# Altium project Interface-Board-7500-0428.PrjPcb (part 3 of 4)
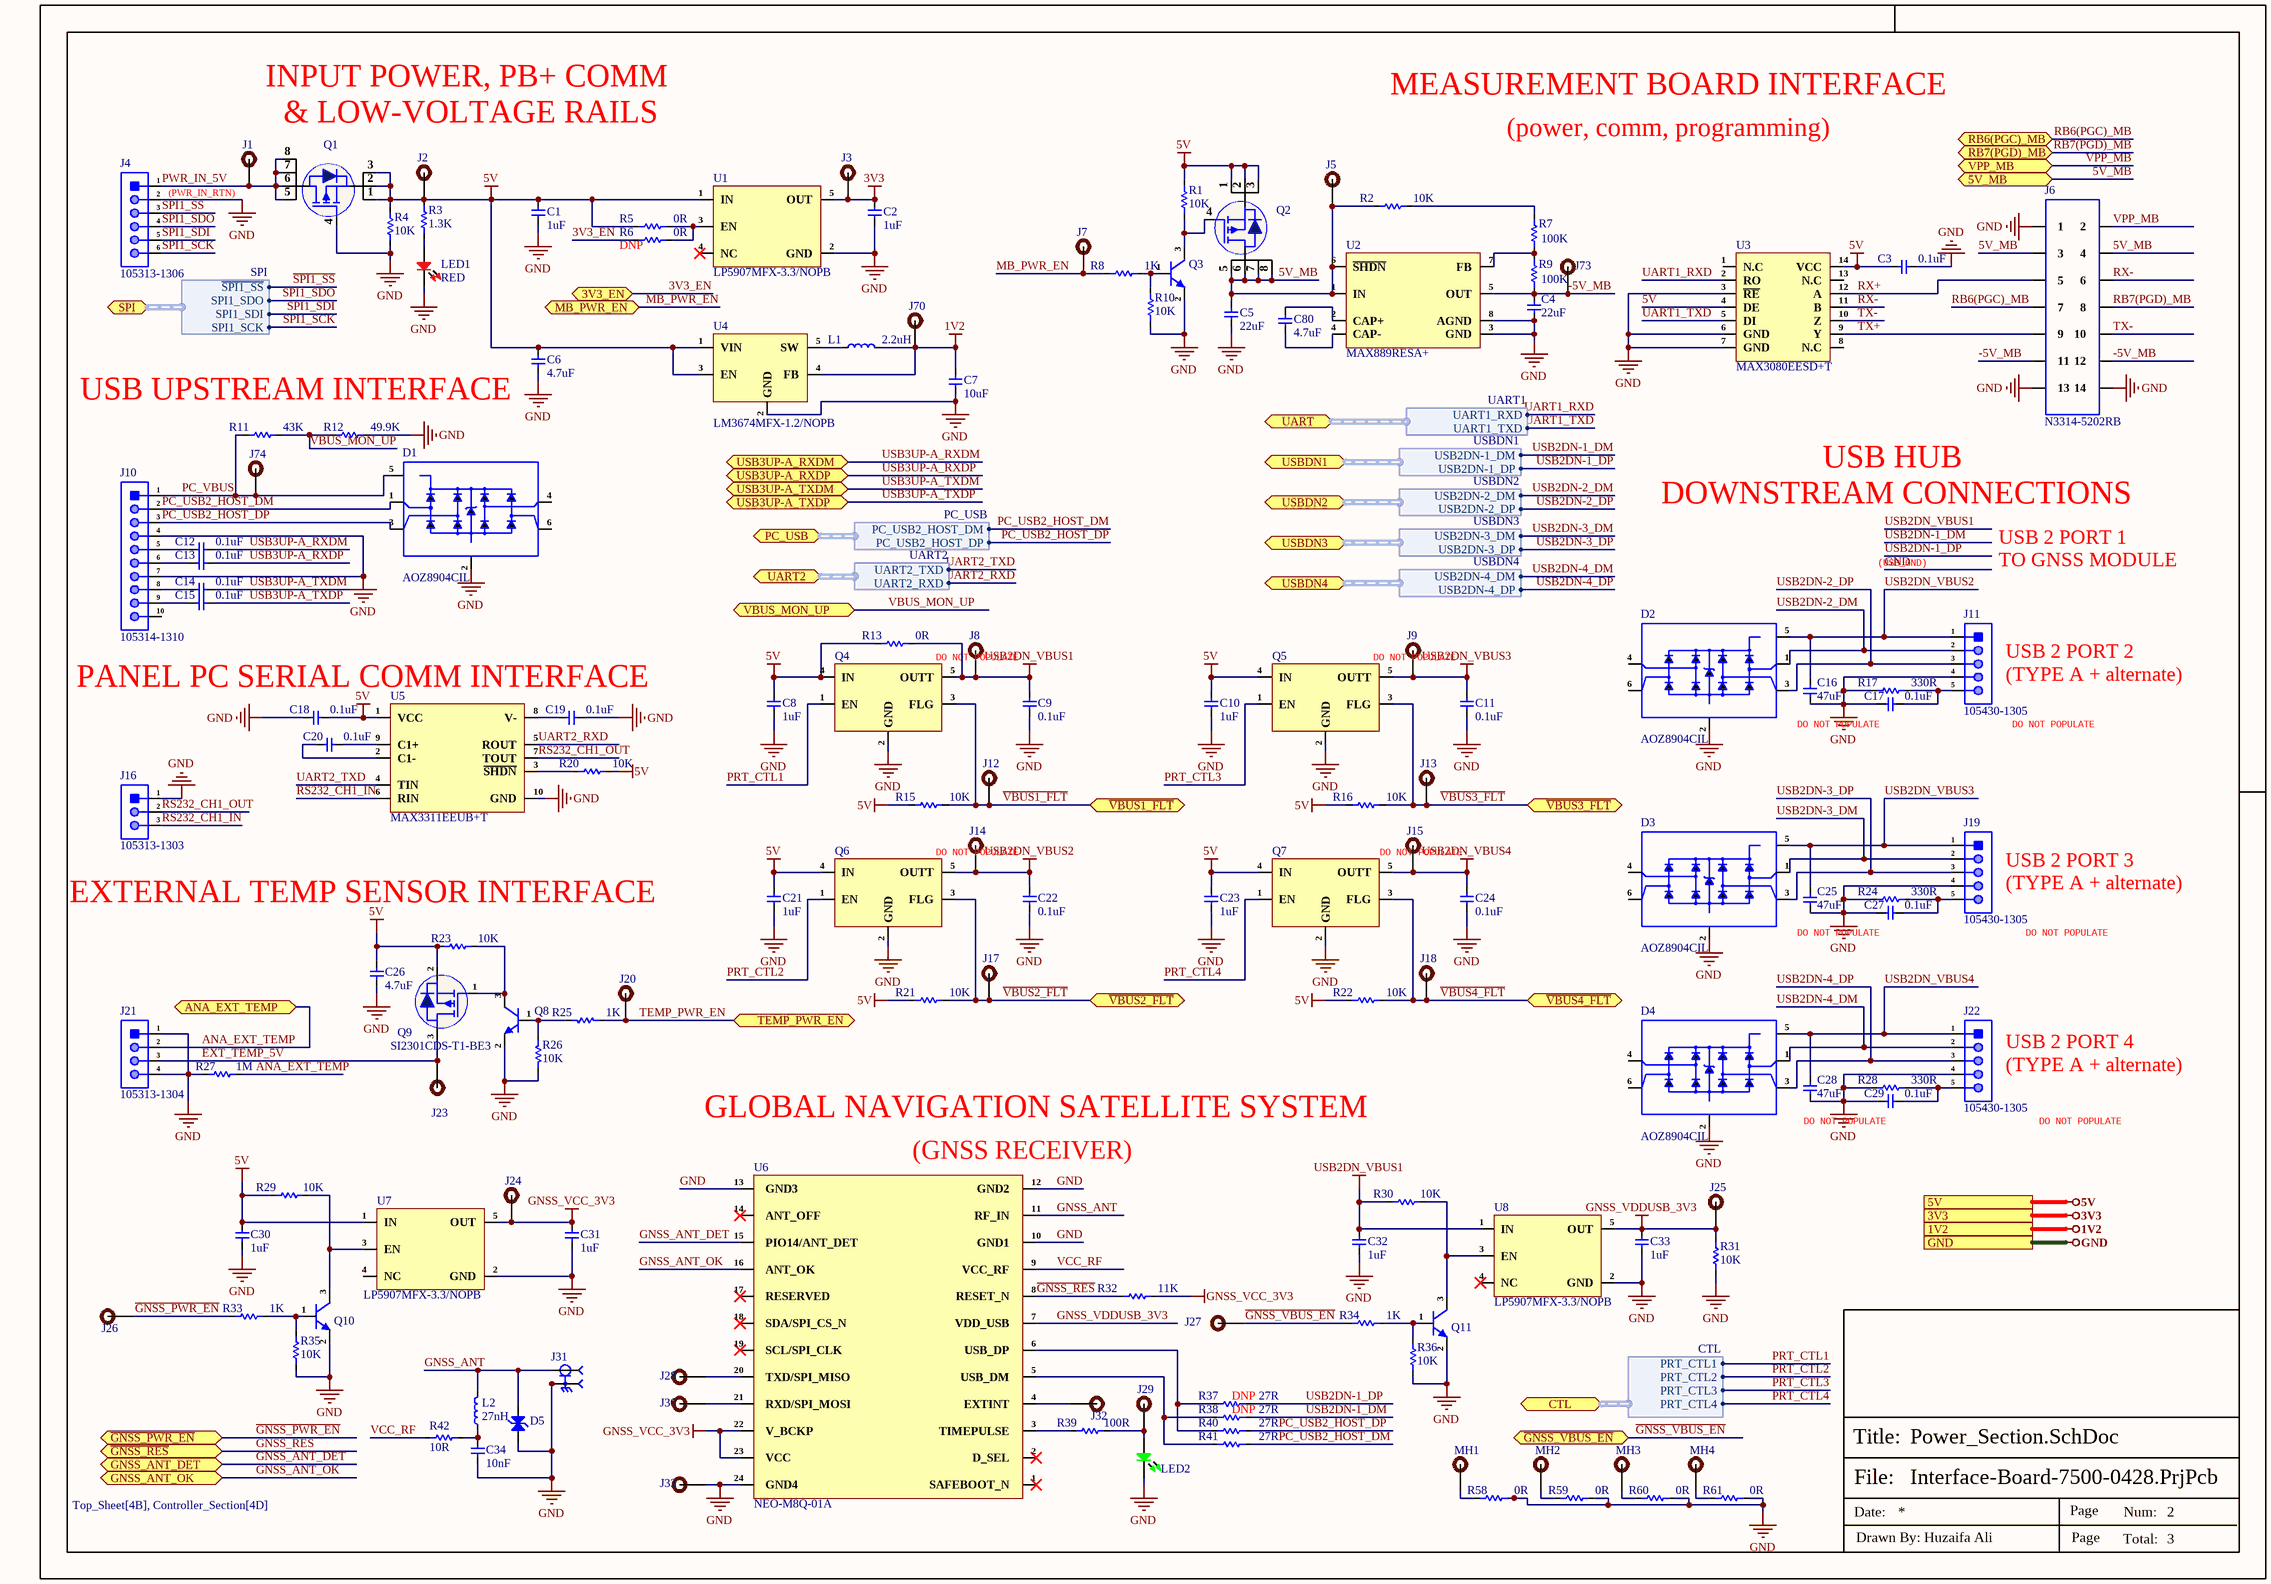
[diagram p4: Power_Section.SchDoc]

## Sheet Power_Section.SchDoc (continued)
### Library data of the parts
C1 C2 C8 C10 C21 C23 C30-C33 = CC0402KRX5R6BB105: CAP CER 1UF 10V X5R 0402; Manufacturer: Yageo; Tolerance: 10%; Dissipation Factor: 15%; Item Type: Capacitor; Supplier 1: Mouser; Manufacturer Part Number: CC0402KRX5R6BB105; RoHS: Yes; Category: Ceramic Capacitors; Stock 1: 6711367; Pricing 1: 1=0.11000, 10=0.05500, 50=0.05500, 100=0.03300, 500=0.02700, 1000=0.02200, 2500=0.02100, 10000=0.01800 (USD); Mount: Surface Mount; Case/Package: 0402; Number of Pins: 2; Case Code (Metric): 1005; Case Code (Imperial): 0402; Min Operating Temperature: -55°C; Max Operating Temperature: 85°C; Capacitance: 1uF; Dielectric: X5R; Package Quantity: 1; Voltage Rating: 10V; Packaging: Tape and Reel; Voltage Rating (DC): 10V; Termination: SMD/SMT; Resistor Type: Ceramic; Series: CC; Construction: Flat; Length: 1mm; Width: 0.02inch; Height: 0.5mm; Thickness: 0.022inch; Depth: 0.5mm; Radiation Hardening: No; REACH SVHC: No SVHC; Lead Free: Lead Free; Halogen Free: Halogen Free; RoHS Compliant: Yes; ComponentLink1URL: https://datasheet.ciiva.com/176/upy-gphc-x5r-4v-to-50v-12-176704.pdf?src-supplier=Digi-Key; ComponentLink1Description: https://datasheet.ciiva.com/176/upy-gphc-x5r-4v-to-50v-12-176704.pdf?src-supplier=Digi-Key; ComponentLink2URL: https://datasheet.ciiva.com/176/mlccorderingcode-176705.pdf?src-supplier=Digi-Key; ComponentLink2Description: https://datasheet.ciiva.com/176/mlccorderingcode-176705.pdf?src-supplier=Digi-Key; ComponentLink3URL: https://datasheet.ciiva.com/176/mlccorderingcode-176706.pdf?src-supplier=Digi-Key; ComponentLink3Description: https://datasheet.ciiva.com/176/mlccorderingcode-176706.pdf?src-supplier=Digi-Key; Supplier Part Number 1: 603-CC402KRX5R6BB105; LCSC Part Number: C106254
C3 C9 C11-C15 C17-C20 C22 C24 C27 C29 = GRM155R71C104KA88D: CAP CER 0.1UF 16V X7R 0402; Manufacturer: Murata; Material: Ceramic; Value: 100nF; Tolerance: 10%; Insulation Resistance: 10GR; Item Type: Capacitor; Supplier 1: Arrow Electronics; Manufacturer Part Number: GRM155R71C104KA88D; RoHS: Yes; Category: Ceramic Capacitors; Stock 1: 1690322; Pricing 1: 10000=0.00480, 30000=0.00470, 100000=0.00350, 250000=0.00330 (USD); Mounting Technology: Surface Mount; Case/Package: 0402; Pins: 2; Case Code (Metric): 1005; Case Code (Imperial): 0402; Dielectric Material: Ceramic; Min Operating Temperature: -55°C; Max Operating Temperature: 125°C; Voltage Rating: 16V; Packaging: Tape and Reel; Voltage Rating (DC): 16V; Package Quantity: 1; Dielectric: X7R; Termination: SMD/SMT; Voltage: 16V; Series: GRM; Length: 1mm; Width: 0.02inch; Height: 0.5mm; Thickness: 0.022inch; Depth: 0.5mm; Radiation Hardening: No; Lead Free: Lead Free; RoHS Compliant: Yes; ComponentLink1URL: https://datasheet.ciiva.com/129/grm155r71c104ka88-01-129739.pdf?src-supplier=Digi-Key; ComponentLink1Description: https://datasheet.ciiva.com/129/grm155r71c104ka88-01-129739.pdf?src-supplier=Digi-Key; ComponentLink2URL: https://datasheet.ciiva.com/129/grm155r71c104ka88-01-129740.pdf?src-supplier=Digi-Key; ComponentLink2Description: https://datasheet.ciiva.com/129/grm155r71c104ka88-01-129740.pdf?src-supplier=Digi-Key; ComponentLink3URL: https://datasheet.ciiva.com/18102/getdatasheetpartid-85307-18102905.pdf?src-supplier=Verical; ComponentLink3Description: https://datasheet.ciiva.com/18102/getdatasheetpartid-85307-18102905.pdf?src-supplier=Verical; ComponentLink4URL: https://datasheet.ciiva.com/29199/454098-da-01-en-vs-kondensator-0402-29199799.pdf?src-supplier=Conrad; ComponentLink4Description: https://datasheet.ciiva.com/29199/454098-da-01-en-vs-kondensator-0402-29199799.pdf?src-supplier=Conrad; ComponentLink5URL: https://datasheet.ciiva.com/7937/4360-7937615.pdf?src-supplier=Element14; ComponentLink5Description: https://datasheet.ciiva.com/7937/4360-7937615.pdf?src-supplier=Element14; ComponentLink6URL: https://datasheet.ciiva.com/14116/grmseries-highdielectrictype-eng-14116878.pdf?src-supplier=Distrelec; ComponentLink6Description: https://datasheet.ciiva.com/14116/grmseries-highdielectrictype-eng-14116878.pdf?src-supplier=Distrelec; ComponentLink7URL: https://datasheet.ciiva.com/14103/grmseries-highdielectrictype-eng-14103750.pdf?src-supplier=Distrelec; ComponentLink7Description: https://datasheet.ciiva.com/14103/grmseries-highdielectrictype-eng-14103750.pdf?src-supplier=Distrelec; ComponentLink8URL: https://datasheet.ciiva.com/28534/4360-28534127.pdf?src-supplier=Element14; ComponentLink8Description: https://datasheet.ciiva.com/28534/4360-28534127.pdf?src-supplier=Element14; ComponentLink9URL: https://datasheet.ciiva.com/28534/4360-28534133.pdf?src-supplier=Element14; ComponentLink9Description: https://datasheet.ciiva.com/28534/4360-28534133.pdf?src-supplier=Element14; ComponentLink10URL: https://datasheet.ciiva.com/16199/product-16199000.pdf?src-supplier=Future+Electronics; ComponentLink10Description: https://datasheet.ciiva.com/16199/product-16199000.pdf?src-supplier=Future+Electronics; Supplier Part Number 1: GRM155R71C104KA88D; LCSC Part Number: C71629
C4 C5 = GRM158R61A226ME15D: CAP CER 22UF 10V X5R 0402; Manufacturer: Murata; Material: 4241ConductorMaterial; Dielectric: 1537DielectricType; Tolerance: 20%; Item Type: Capacitor; Supplier: Mouser; Supplier Part Number: 81-GRM158R61A226ME5D; Manufacturer Part Number: GRM158R61A226ME15D; RoHS: Yes; Category: Ceramic Capacitors; Stock: 328944; Pricing: 1=0.46, 10=0.225, 50=0.225, 100=0.146, 1000=0.124, 10000=0.106 (USD); Case/Package: 343Case; Min Operating Temperature: -55°C; Max Operating Temperature: 85°C; Value: 22uF; Voltage Rating: 10V; Voltage Rating (DC): 10V; Length: 1mm; Width: 500um; Height: 800um; Thickness: 800um; LCSC Part Number: C3845593
C6 C26 C80 = CC0402KRX5R6BB475: CAP CER 4.7UF 10V X5R 0402; Manufacturer: Yageo; Tolerance: 10%; Supplier 1: Farnell; Manufacturer Part Number: CC0402KRX5R6BB475; RoHS: Yes; Category: Ceramic Capacitors; Stock 1: 20000; Pricing 1: 10000=0.02310, 50000=0.02100 (GBP); Mount: Surface Mount; Case/Package: 0402; Case Code (Imperial): 0402; Case Code (Metric): 1005; Min Operating Temperature: -55°C; Max Operating Temperature: 85°C; Packaging: Cut Tape; Capacitance: 4.7uF; Voltage Rating: 10V; RoHS Compliant: Yes; ComponentLink1URL: http://www.yageo.com/documents/recent/UPY-GPHC_X5R_4V-to-50V_25.pdf?src-supplier=Digi-Key; ComponentLink1Description: http://www.yageo.com/documents/recent/UPY-GPHC_X5R_4V-to-50V_25.pdf?src-supplier=Digi-Key; Supplier Part Number 1: 3871698; LCSC Part Number: C326586
C7 = CC0402MRX5R6BB106: CAP CER 10UF 10V X5R 0402; Manufacturer: Yageo; Tolerance: 20%; Item Type: Capacitor; Supplier 1: Future Electronics; Manufacturer Part Number: CC0402MRX5R6BB106; RoHS: Yes; Category: Ceramic Capacitors; Stock 1: 80000; Pricing 1: 10000=0.02650, 20000=0.02590, 30000=0.02550, 40000=0.02530, 50000=0.02450 (USD); Mount: Surface Mount; Case/Package: 0402; Case Code (Imperial): 0402; Case Code (Metric): 1005; Min Operating Temperature: -55°C; Max Operating Temperature: 85°C; Packaging: Tape and Reel; Capacitance: 10uF; Voltage Rating: 10V; RoHS Compliant: Yes; ComponentLink1URL: http://www.yageo.com/documents/recent/UPY-GPHC_X5R_4V-to-50V_25.pdf?src-supplier=Digi-Key; ComponentLink1Description: http://www.yageo.com/documents/recent/UPY-GPHC_X5R_4V-to-50V_25.pdf?src-supplier=Digi-Key; Supplier Part Number 1: 6097631; LCSC Part Number: C962143
C16 C25 C28 = CC0805MKX5R5BB476: CAP CER 47UF 6.3V X5R 0805; Manufacturer: Yageo; Tolerance: 20%; Item Type: Capacitor; Supplier 1: Arrow Electronics; Manufacturer Part Number: CC0805MKX5R5BB476; RoHS: Yes; Category: Ceramic Capacitors; Stock 1: 6; Pricing 1: 1=0.25650 (USD); Mount: Surface Mount; Case/Package: 0805; Case Code (Imperial): 0805; Case Code (Metric): 2012; Weight: 0.000194oz; Min Operating Temperature: -55°C; Max Operating Temperature: 85°C; Capacitance: 47uF; Packaging: Tape and Reel; Voltage Rating (DC): 6.3V; Dielectric: X5R; Voltage Rating: 6.3V; Termination: SMD/SMT; Resistor Type: Ceramic; Series: CC; Construction: Flat; Length: 2mm; Width: 0.049inch; Thickness: 0.057inch; Depth: 1.25mm; Radiation Hardening: No; Lead Free: Lead Free; Halogen Free: Halogen Free; RoHS Compliant: Yes; ComponentLink1URL: http://www.mouser.com/ds/2/447/UPY-GPHC_X5R_4V-to-50V_25-1131599.pdf?src-supplier=Mouser; ComponentLink1Description: http://www.mouser.com/ds/2/447/UPY-GPHC_X5R_4V-to-50V_25-1131599.pdf?src-supplier=Mouser; ComponentLink2URL: http://www.yageo.com/documents/recent/UPY-GPHC_X5R_4V-to-50V_25.pdf?src-supplier=Digi-Key; ComponentLink2Description: http://www.yageo.com/documents/recent/UPY-GPHC_X5R_4V-to-50V_25.pdf?src-supplier=Digi-Key; ComponentLink3URL: http://www.yageo.com/documents/recent/UPY-GPHC_X5R_4V-to-50V_19.pdf?src-supplier=Avnet; ComponentLink3Description: http://www.yageo.com/documents/recent/UPY-GPHC_X5R_4V-to-50V_19.pdf?src-supplier=Avnet; Supplier Part Number 1: CC0805MKX5R5BB476; LCSC Part Number: C109461
C34 = CC0603KRX7R7BB103: CAP CER 10000PF 16V X7R 0603; Manufacturer: Yageo; Tolerance: 10%; Item Type: Capacitor; Supplier 1: Arrow Electronics; Manufacturer Part Number: CC0603KRX7R7BB103; RoHS: Yes; Category: Ceramic Capacitors; Stock 1: 3; Pricing 1: 1=0.03600 (USD); Mount: Surface Mount; Case/Package: 0603; Case Code (Imperial): 0603; Case Code (Metric): 1608; Min Operating Temperature: -55°C; Max Operating Temperature: 125°C; Capacitance: 10nF; Voltage Rating: 16V; Voltage Rating (DC): 16V; Packaging: Tape and Reel; Dielectric: X7R; Termination: SMD/SMT; Resistor Type: Ceramic; Series: CC; Construction: Flat; Length: 1.6mm; Width: 0.8mm; Height: 0.8mm; Thickness: 0.035inch; Depth: 0.8mm; Radiation Hardening: No; Lead Free: Lead Free; Halogen Free: Halogen Free; RoHS Compliant: Yes; ComponentLink1URL: https://datasheet.ciiva.com/7978/1489800-7978139.pdf?src-supplier=Element14; ComponentLink1Description: https://datasheet.ciiva.com/7978/1489800-7978139.pdf?src-supplier=Element14; Supplier Part Number 1: CC0603KRX7R7BB103; LCSC Part Number: C519406
D1-D4 = AOZ8904CIL: Ultra-Low Capacitance TVS Diode Array, SOT-23-6L, RoHS; Manufacturer: Alpha & Omega Semiconductor; Direction: Unidirectional; Number of Bidirectional Channels: 4; Reverse Standoff Voltage: 5.5V; Min Breakdown Voltage: 6.6V; Clamping Voltage: 18V; Peak Pulse Power: 50W; Power Line Protection: Yes; Leakage Current: 1uA; Peak Pulse Current: 4A; Item Type: IC; Supplier: Digikey; Supplier Part Number: 785-1755-1-ND; Manufacturer Part Number: AOZ8904CIL; RoHS: Yes; Category: TVS Diodes; Stock: 1165949; Pricing: 1=0.34, 10=0.235, 100=0.1187, 500=0.09684, 1000=0.07185 (USD); Mounting Technology: Surface Mount; Case/Package: SOT-23-6; Pins: 6; Min Operating Temperature: -40°C; Max Operating Temperature: 125°C; Packaging: Tape and Reel; Package Quantity: 6000; Working Voltage: 5.5V; Series: -; Number of Unidirectional Channels: 4; Length: 2.9mm; Depth: 1.6mm; Radiation Hardening: No; RoHS Compliant: Yes; ComponentLink1URL: https://datasheet.ciiva.com/6575/aoz8904cil-6575149.pdf?src-supplier=Digikey; ComponentLink1Description: https://datasheet.ciiva.com/6575/aoz8904cil-6575149.pdf?src-supplier=Digikey; Package: SOT-23-6; JLCPCB Part Number: C2649893; ComponentLink2Description: JLCPCB; ComponentLink2URL: https://jlcpcb.com/partdetail/Alpha_OmegaSemicon-AOZ8904CIL/C2649893
D5 = ACPDQC3V3HT-HF: AUTOMOTIVE DIODE ESD 3.3VWM 5.5V; Manufacturer: Comchip; Supplier: Digikey; Supplier Part Number: 641-ACPDQC3V3HT-HFCT-ND; Manufacturer Part Number: ACPDQC3V3HT-HF; RoHS: No; Stock: 4462; Pricing: 1=0.37, 10=0.255, 100=0.1244, 500=0.10378, 1000=0.07211, 2000=0.0625 (USD); Item Type: Diode
J4 = 105313-1306: CONN HEADER R/A 6POS 2.5MM; Manufacturer: Molex; Supplier: Mouser; Supplier Part Number: 538-105313-1306; Manufacturer Part Number: 105313-1306; RoHS: Yes; Item Type: Header; Stock: 1427; Pricing: 1=2.09, 10=1.9, 50=1.9, 100=1.65, 1000=1.48, 10000=1.39 (USD); ComponentLink1URL: https://www.molex.com/pdm_docs/sd/1053131102_sd.pdf?src-supplier=Digikey; ComponentLink1Description: https://www.molex.com/pdm_docs/sd/1053131102_sd.pdf?src-supplier=Digikey
J6 = N3314-5202RB: 3000 Series; 2.54mm Pitch 14 Way 2 Row Right Angle PCB Header; Solder Term; 2A; Manufacturer: 3M; Number of Contacts: 14; Gender: Male; Current Rating: 1A; Voltage Rating (AC): 350V; Voltage Rating: 1kV; Supplier: Digikey; Supplier Part Number: MHR14S-ND; Manufacturer Part Number: N3314-5202RB; RoHS: Yes; Category: Headers and Wire Housings; Stock: 7247; Pricing: 1=2.23, 10=2.026, 350=1.57111 (USD); Mounting Technology: Through Hole; Contact Plating: Gold; Contact Material: Copper Alloy,Copper; Color: Black; Housing Color: Black; Housing Material: Polyester; Contact Shape: Square; Contact Finish - Mating: GOLD; Insulation Material: Glass; Insulation Color: Black; Min Operating Temperature: -55°C; Max Operating Temperature: 105°C; Number of Rows: 2; Packaging: Bulk; Termination: Solder; Max Current Rating: 2A; Package Quantity: 100; Fastening Type: Latch; Number of Poles: 14; Number of Positions: 14; Working Voltage: 350V; Orientation: Right Angle; Connector Type: Header; Series: 3000; Contact Type: Male Pin; Length: 37.21mm; Pitch: 2.54mm; Lead Pitch: 2.54mm; Depth: 24.6mm; Reach SVHC Compliant: No; Lead Free: Lead Free; RoHS Compliant: Yes; Flammability Rating: UL94 V-0; ComponentLink1URL: https://datasheet.ciiva.com/15188/getdatasheetpartid-335427-15188603.pdf?src-supplier=Verical; ComponentLink1Description: https://datasheet.ciiva.com/15188/getdatasheetpartid-335427-15188603.pdf?src-supplier=Verical; ComponentLink2URL: https://datasheet.ciiva.com/11754/0900766b8077b7df-11754186.pdf?src-supplier=Rs; ComponentLink2Description: https://datasheet.ciiva.com/11754/0900766b8077b7df-11754186.pdf?src-supplier=Rs; ComponentLink3URL: https://datasheet.ciiva.com/719/ts0772-719288.pdf?src-supplier=Digikey; ComponentLink3Description: https://datasheet.ciiva.com/719/ts0772-719288.pdf?src-supplier=Digikey; ComponentLink4URL: https://datasheet.ciiva.com/8051/94653-8051014.pdf?src-supplier=Element14; ComponentLink4Description: https://datasheet.ciiva.com/8051/94653-8051014.pdf?src-supplier=Element14; Item Type: Header
J10 = 105314-1310: CONN HEADER R/A 10POS 2.5MM; Manufacturer: Molex; Item Type: Headers; Number of Positions: 10; Supplier: Mouser; Supplier Part Number: 538-105314-1310; Manufacturer Part Number: 105314-1310; RoHS: Yes; Stock: 1648; Pricing: 1=2.66, 10=2.31, 50=2.31, 100=2.15, 1000=2.15, 10000=1.95 (USD); Mounting Technology: Through Hole; Contact Material: Brass; Contact Shape: Square; Insulation Material: Polymer; Insulation Color: Black; Contact Finish - Mating: GOLD; Min Operating Temperature: -40°C; Max Operating Temperature: 105°C; Connector Type: Header; Fastening Type: Latch; Packaging: Tray; Number of Rows: 2; Termination: Solder; Series: Nano-Fit 105314; Contact Type: Male Pin; RoHS Compliant: Yes; ComponentLink1URL: https://www.molex.com/pdm_docs/sd/1053141104_sd.pdf?src-supplier=Digikey; ComponentLink1Description: https://www.molex.com/pdm_docs/sd/1053141104_sd.pdf?src-supplier=Digikey; ComponentLink2URL: http://www.farnell.com/datasheets/2788570.pdf?src-supplier=Newark; ComponentLink2Description: http://www.farnell.com/datasheets/2788570.pdf?src-supplier=Newark
J11 J19 J22 = 105430-1305: NANO-FIT HDR SMT RA SGL 5CKT 30A; Manufacturer: Molex; Item Type: Header; Supplier: Mouser; Supplier Part Number: 538-105430-1305; Manufacturer Part Number: 105430-1305; RoHS: No; Stock: 818; Pricing: 1=3.62, 10=3.19, 50=3.19, 100=2.54, 1000=2.19, 10000=2.15 (USD)
J16 = 105313-1303: CONN HEADER R/A 3POS 2.5MM; Manufacturer: Molex; Number of Positions: 3; Voltage Rating: 250V; Supplier: Mouser; Supplier Part Number: 538-105313-1303; Manufacturer Part Number: 105313-1303; RoHS: Yes; Item Type: Header; Stock: 1725; Pricing: 1=1.27, 10=1.08, 50=1.08, 100=0.945, 1000=0.945, 10000=0.945 (USD); Mounting Technology: Through Hole; Contact Material: Brass; Contact Shape: Square; Insulation Material: Polymer; Insulation Color: Black; Contact Finish - Mating: GOLD; Min Operating Temperature: -40°C; Max Operating Temperature: 105°C; Number of Rows: 1; Connector Type: Header; Fastening Type: Latch; Packaging: Tray; Termination: Solder; Series: Nano-Fit 105313; Contact Type: Male Pin; RoHS Compliant: Yes; ComponentLink1URL: https://www.molex.com/pdm_docs/sd/1053131102_sd.pdf?src-supplier=Digikey; ComponentLink1Description: https://www.molex.com/pdm_docs/sd/1053131102_sd.pdf?src-supplier=Digikey
J21 = 105313-1304: CONN HEADER R/A 4POS 2.5MM; Manufacturer: Molex; Plating: 154ConductorMaterial; Number of Positions: 4; Voltage Rating: 250V; Current Rating: 8A; Number of Circuits: 4NUMBER; Supplier: Mouser; Supplier Part Number: 538-105313-1304; Manufacturer Part Number: 105313-1304; RoHS: Yes; Item Type: Header; Stock: 4079; Pricing: 1=1.61, 10=1.45, 50=1.45, 100=1.26, 1000=1.11, 10000=1.11 (USD); Mounting Technology: Through Hole; Contact Material: Brass; Contact Shape: Square; Insulation Material: Polymer; Insulation Color: Black; Contact Finish - Mating: GOLD; Min Operating Temperature: -40°C; Max Operating Temperature: 105°C; Connector Type: Header; Fastening Type: Latch; Packaging: Tray; Number of Rows: 1; Termination: Solder; Series: Nano-Fit 105313; Contact Type: Male Pin; Number of Contacts: 4NUMBER; Orientation: 5492OrientationType; Height: 6.84mm; RoHS Compliant: Yes; ComponentLink1URL: http://www.farnell.com/datasheets/2788568.pdf?src-supplier=Farnell; ComponentLink1Description: http://www.farnell.com/datasheets/2788568.pdf?src-supplier=Farnell; ComponentLink2URL: http://www.farnell.com/datasheets/2788568.pdf?src-supplier=Newark; ComponentLink2Description: http://www.farnell.com/datasheets/2788568.pdf?src-supplier=Newark; ComponentLink3URL: https://www.molex.com/pdm_docs/sd/1053131102_sd.pdf?src-supplier=Digikey; ComponentLink3Description: https://www.molex.com/pdm_docs/sd/1053131102_sd.pdf?src-supplier=Digikey
J31 = SMA-J-P-H-ST-TH1: CONN SMA JACK STR 50 OHM PCB; Manufacturer: Samtec; Item Type: RF / Coaxial Connectors; Frequency: 20GHz; Number of Contacts: 1NUMBER; Supplier: Arrow Electronics; Supplier Part Number: SMA-J-P-H-ST-TH1; Manufacturer Part Number: SMA-J-P-H-ST-TH1; RoHS: Yes; Stock: 32413; Pricing: 1=5.81, 25=5.03, 50=4.25 (USD); ComponentLink1URL: https://datasheet.ciiva.com/646/sma-j-p-x-st-th1-mkt-646059.pdf?src-supplier=Digikey; ComponentLink1Description: https://datasheet.ciiva.com/646/sma-j-p-x-st-th1-mkt-646059.pdf?src-supplier=Digikey
L1 = NR3012T2R2M: FIXED IND 2.2UH 1.2A 96 MOHM SMD; Manufacturer: Taiyo Yuden; Item Type: Inductors; Supplier 1: Digikey; Manufacturer Part Number: NR3012T2R2M; RoHS: Yes; Stock 1: 5366; Pricing 1: 1=0.24, 10=0.196, 25=0.1812, 50=0.166, 100=0.1463, 250=0.14184, 500=0.12674, 1000=0.10625 (USD); ComponentLink1URL: https://datasheet.ciiva.com/8499/nr3012t2r2m-ss-8499238.pdf?src-supplier=Avnet; ComponentLink1Description: https://datasheet.ciiva.com/8499/nr3012t2r2m-ss-8499238.pdf?src-supplier=Avnet; ComponentLink2URL: https://datasheet.ciiva.com/1043/wound04-e-1043497.pdf?src-supplier=Digikey; ComponentLink2Description: https://datasheet.ciiva.com/1043/wound04-e-1043497.pdf?src-supplier=Digikey; ComponentLink3URL: https://datasheet.ciiva.com/1043/wound04-e-1043498.pdf?src-supplier=Digikey; ComponentLink3Description: https://datasheet.ciiva.com/1043/wound04-e-1043498.pdf?src-supplier=Digikey; ComponentLink4URL: https://datasheet.ciiva.com/1043/wound04-e-1043499.pdf?src-supplier=Digikey; ComponentLink4Description: https://datasheet.ciiva.com/1043/wound04-e-1043499.pdf?src-supplier=Digikey; ComponentLink5URL: https://datasheet.ciiva.com/8002/wound04-e-8002122.pdf?src-supplier=Element14; ComponentLink5Description: https://datasheet.ciiva.com/8002/wound04-e-8002122.pdf?src-supplier=Element14; Supplier Part Number 1: 587-1642-1-ND; LCSC Part Number: C525010
L2 = B82496C3270J000: FIXED IND 27NH 360MA 550MOHM SMD; Manufacturer: TDK EPCOS; Item Type: Inductor; Supplier 1: Digikey; Manufacturer Part Number: B82496C3270J000; RoHS: Yes; Stock 1: 40469; Pricing 1: 1=0.36, 10=0.291, 25=0.2688, 50=0.2464, 100=0.2172, 250=0.21052, 500=0.18814, 1000=0.1523 (USD); ComponentLink1URL: https://datasheet.ciiva.com/22704/78400-22704383.pdf?src-supplier=Element14; ComponentLink1Description: https://datasheet.ciiva.com/22704/78400-22704383.pdf?src-supplier=Element14; ComponentLink2URL: https://datasheet.ciiva.com/22684/78400-22684183.pdf?src-supplier=Element14; ComponentLink2Description: https://datasheet.ciiva.com/22684/78400-22684183.pdf?src-supplier=Element14; Supplier Part Number 1: 495-2029-1-ND; LCSC Part Number: C2046375
LED1 = NCD0603R3: RED LED 0603 Light Emitting Diodes; Manufacturer: Foshan NationStar Optoelectronics; Manufacturer Part Number: NCD0603R3; Package: 0603; Item Type: LED; LCSC Part Number: C3151730; ComponentLink1Description: LCSC; ComponentLink1URL: https://www.lcsc.com/product-detail/Light-Emitting-Diodes-LED_Foshan-NationStar-Optoelectronics-NCD0603R3_C3151730.html
LED2 = NCD0603G2: Emerald 0603 Light Emitting Diodes (LED) ROHS; Manufacturer: Foshan NationStar Optoelectronics; Manufacturer Part Number: NCD0603G2; Package: 0603; LCSC Part Number: C87326; Item Type: LED; ComponentLink1Description: LCSC; ComponentLink1URL: https://www.lcsc.com/product-detail/Light-Emitting-Diodes-LED_Foshan-NationStar-Optoelectronics-NCD0603G2_C87326.html
MH1-MH4 = M4 Mounting Hole: -; Manufacturer Part Number: M4 Mounting Hole; Item Type: Mounting Hole
Q1 Q2 = SI4463DY: 20V 11.5A 12mΩ@11.5A,4.5V 1W 1.5V@250uA 1PCSPChannel SOIC-8 MOSFETs ROHS; Manufacturer: ON Semiconductor / Fairchild; Rise Time: 15ns; Fall Time: 60ns; Turn-Off Delay Time: 120ns; Continuous Drain Current (ID): -11.5A; Gate to Source Voltage (Vgs): 12V; Drain to Source Resistance: 10mR; Polarity: P-CHANNEL; Power Dissipation: 2.5W; Drain to Source Breakdown Voltage: -20V; Supplier: Farnell; LCSC Part Number: C3279922; Manufacturer Part Number: SI4463DY; RoHS: Yes; Item Type: MOSFETs; Stock: 188616; Pricing: 472=0.62 (GBP); Case/Package: SOIC; Pins: 8; Min Operating Temperature: -55°C; Max Operating Temperature: 150°C; Package Quantity: 2500; Packaging: Tape and Reel; RoHS Compliant: Yes; ComponentLink1URL: http://components.arrow.com/part/dataview/3004105S7561270N7769?src-supplier=Arrow+Electronics; ComponentLink1Description: http://components.arrow.com/part/dataview/3004105S7561270N7769?src-supplier=Arrow+Electronics
Q3 Q8 Q10 Q11 = MMBT2222ATT3G: Small Signal Bipolar Transistor, 0.6A I(C), 40V V(BR)CEO, 1-Element, NPN, Silicon; Manufacturer: ON Semiconductor; Supplier: Digikey; Supplier Part Number: MMBT2222ATT3GOSCT-ND; Manufacturer Part Number: MMBT2222ATT3G; RoHS: Yes; Category: BJTs; Stock: 7029; Pricing: 1=0.12, 10=0.082, 100=0.0441, 500=0.03466, 1000=0.02407, 2000=0.01994, 5000=0.01885 (USD); ComponentLink1URL: https://datasheet.ciiva.com/980/mmbt2222lt1-d-980718.pdf?src-supplier=Digikey; ComponentLink1Description: https://datasheet.ciiva.com/980/mmbt2222lt1-d-980718.pdf?src-supplier=Digikey; ComponentLink2URL: https://datasheet.ciiva.com/4724/mmbt2222att1-d-81771-4724629.pdf?src-supplier=Mouser; ComponentLink2Description: https://datasheet.ciiva.com/4724/mmbt2222att1-d-81771-4724629.pdf?src-supplier=Mouser
Q4-Q7 = AP22816BKAWT-7: USBPOWERSWITCHTSOT25T&R3K; Manufacturer: Diodes; Item Type: IC; Number of Channels: 1NUMBER; Supplier: Digikey; Supplier Part Number: 31-AP22816BKAWT-7CT-ND; Manufacturer Part Number: AP22816BKAWT-7; RoHS: No; Stock: 8685; Pricing: 1=0.31, 10=0.248, 25=0.2264, 100=0.1686, 250=0.15276, 500=0.12644, 1000=0.09483 (USD)
Q9 = SI2301CDS-T1-BE3: Transistor MOSFET P-CH 20V 3.1A 3-Pin SOT-23; Manufacturer: Vishay; Continuous Drain Current (ID): -2.3A; Drain to Source Breakdown Voltage: -20V; Drain to Source Resistance: 90mR; Gate to Source Voltage (Vgs): 8V; Number of Channels: 1NUMBER; Power Dissipation: 860mW; Turn-Off Delay Time: 30ns; Turn-On Delay Time: 11ns; Supplier: Digikey; Supplier Part Number: 742-SI2301CDS-T1-BE3CT-ND; Manufacturer Part Number: SI2301CDS-T1-BE3; RoHS: Yes; Category: MOSFETs; Stock: 6842; Pricing: 1=0.37, 10=0.289, 100=0.1734, 500=0.1606, 1000=0.1092 (USD); Min Operating Temperature: -55°C; Max Operating Temperature: 150°C; Drain to Source Voltage (Vdss): -20V; Height: 1.12mm
R1 R2 R4 R10 R15 R16 R20-R23 R26 R29-R31 R35 R36 = RT0402BRD0710KL: RES SMD 10K OHM 0.1% 1/16W 0402; Manufacturer: Yageo; Item Type: Resistor; Supplier: Future Electronics; Supplier Part Number: 1236728; Manufacturer Part Number: RT0402BRD0710KL; RoHS: Yes; Category: Chip SMD Resistors; Stock: 490000; Pricing: 10000=0.0218, 20000=0.0213, 30000=0.021, 50000=0.0206, 100000=0.0199 (USD); ComponentLink1URL: https://datasheet.ciiva.com/12836/pyu-rt-1-to-0-05-rohs-l-4-12836454.pdf?src-supplier=Mouser; ComponentLink1Description: https://datasheet.ciiva.com/12836/pyu-rt-1-to-0-05-rohs-l-4-12836454.pdf?src-supplier=Mouser; LCSC Part Number: C190095
R3 = ERJ-2GEJ132X: RES SMD 1.3K OHM 5% 1/10W 0402
R5 R6 R13 = RCS04020000Z0ED: RES SMD 0 OHM JUMPER 1/5W 0402; Manufacturer: Vishay Dale; Resistance: 0mR; Max Power Dissipation: 200mW; Item Type: Resistor; Supplier 1: Digi-Key; Manufacturer Part Number: RCS04020000Z0ED; Stock 1: 35470; Pricing 1: 1=0.1, 10=0.083, 25=0.0576, 50=0.0448, 100=0.032, 250=0.02496, 500=0.01984, 1000=0.01408, 5000=0.01088 (USD); Case/Package: 0402; Case Code (Metric): 1005; Case Code (Imperial): 0402; Min Operating Temperature: -55°C; Max Operating Temperature: 155°C; Packaging: Tape and Reel; Resistor Type: Thick Film; Number of Terminations: 2; Features: Automotive AEC-Q200; Length: 0.039inch; Width: 0.02inch; Height: 0.016inch; RoHS Compliant: Yes; ComponentLink1URL: http://www.farnell.com/datasheets/2618474.pdf?src-supplier=Farnell; ComponentLink1Description: http://www.farnell.com/datasheets/2618474.pdf?src-supplier=Farnell; ComponentLink2URL: http://www.farnell.com/datasheets/2618474.pdf?src-supplier=Element14; ComponentLink2Description: http://www.farnell.com/datasheets/2618474.pdf?src-supplier=Element14; ComponentLink3URL: http://www.vishay.com/docs/20065/rcse3.pdf?src-supplier=Digi-Key; ComponentLink3Description: http://www.vishay.com/docs/20065/rcse3.pdf?src-supplier=Digi-Key; ComponentLink4URL: http://www.farnell.com/datasheets/2618474.pdf?src-supplier=Newark; ComponentLink4Description: http://www.farnell.com/datasheets/2618474.pdf?src-supplier=Newark; Supplier Part Number 1: 541-2877-1-ND; LCSC Part Number: C844673
R7 R9 = RT0402BRD07100KL: RES SMD 100K OHM 0.1% 1/16W 0402; Manufacturer: Yageo; Voltage Rating (DC): 50V; Item Type: Resistor; Supplier: Digikey; Supplier Part Number: YAG1343CT-ND; Manufacturer Part Number: RT0402BRD07100KL; RoHS: Yes; Category: Chip SMD Resistors; Stock: 62932; Pricing: 1=0.16, 10=0.121, 50=0.0958, 100=0.0859, 500=0.0654, 1000=0.0578, 5000=0.04283 (USD); ComponentLink1URL: https://datasheet.ciiva.com/12724/pyu-rt-1-to-0-05-rohs-l-4-12724954.pdf?src-supplier=Mouser; ComponentLink1Description: https://datasheet.ciiva.com/12724/pyu-rt-1-to-0-05-rohs-l-4-12724954.pdf?src-supplier=Mouser; LCSC Part Number: C852472
R8 R25 R33 R34 = RC0402FR-071KL: RES 1K OHM 1% 1/16W 0402; Manufacturer: Yageo; Resistance: 1kR; Temperature Coefficient: 100ppm/°C; Voltage Rating (DC): 50V; Power Rating: 62.5mW; Max Power Dissipation: 63mW; Item Type: Resistor; Supplier 1: Avnet; Manufacturer Part Number: RC0402FR-071KL; RoHS: Yes; Category: Chip SMD Resistors; Stock 1: 13030000; Pricing 1: 10000=0.00085, 20000=0.00087, 40000=0.00084, 60000=0.00083, 80000=0.00079, 100000=0.00078, 1000000=0.00076 (USD); Case/Package: 0402; Number of Pins: 2; Case Code (Imperial): 0402; Case Code (Metric): 1005; Size Code: 0402; Min Operating Temperature: -55°C; Max Operating Temperature: 155°C; Resistor Type: Thick Film; Tolerance: 1%; Packaging: Tape and Reel; Voltage Rating: 50V; Termination: SMD/SMT; Features: Moisture Resistant; Series: RC; Number of Terminations: 2; Resistance Tolerance: 1%; Construction: Rectangular; Technology: THICK FILM; Length: 1mm; Width: 0.5mm; Height: 0.32mm; Depth: 0.5mm; Reach SVHC Compliant: Yes; Lead Free: Lead Free; RoHS Compliant: Yes; Military Standard: Not; ComponentLink1URL: https://datasheet.ciiva.com/11819/0900766b80c66297-11819477.pdf?src-supplier=RSComponents; ComponentLink1Description: https://datasheet.ciiva.com/11819/0900766b80c66297-11819477.pdf?src-supplier=RSComponents; ComponentLink2URL: https://datasheet.ciiva.com/7983/1018594-7983502.pdf?src-supplier=Element14; ComponentLink2Description: https://datasheet.ciiva.com/7983/1018594-7983502.pdf?src-supplier=Element14; ComponentLink3URL: https://datasheet.ciiva.com/22747/1018594-22747513.pdf?src-supplier=Element14; ComponentLink3Description: https://datasheet.ciiva.com/22747/1018594-22747513.pdf?src-supplier=Element14; ComponentLink4URL: https://datasheet.ciiva.com/12666/pyu-rc0402-51-rohs-l-6-r-12666741.pdf?src-supplier=Mouser; ComponentLink4Description: https://datasheet.ciiva.com/12666/pyu-rc0402-51-rohs-l-6-r-12666741.pdf?src-supplier=Mouser; ComponentLink5URL: https://datasheet.ciiva.com/7849/1018594-7849869.pdf?src-supplier=Element14; ComponentLink5Description: https://datasheet.ciiva.com/7849/1018594-7849869.pdf?src-supplier=Element14; ComponentLink6URL: https://datasheet.ciiva.com/7849/1018594-7849871.pdf?src-supplier=Element14; ComponentLink6Description: https://datasheet.ciiva.com/7849/1018594-7849871.pdf?src-supplier=Element14; ComponentLink7URL: https://datasheet.ciiva.com/17063/pyu-rc0402-51-rohs-l-6-r-17063193.pdf?src-supplier=Future+Electronics; ComponentLink7Description: https://datasheet.ciiva.com/17063/pyu-rc0402-51-rohs-l-6-r-17063193.pdf?src-supplier=Future+Electronics; Supplier Part Number 1: RC0402FR-071KL; LCSC Part Number: C106235
R11 = RC0402FR-0743KL: RES 43K OHM 1% 1/16W 0402; Manufacturer: Yageo; Resistance: 43kR; Power Rating: 63mW; Voltage Rating: 50V; Temperature Coefficient: 100ppm/°C; Item Type: Resistor; Supplier 1: Digi-Key; Manufacturer Part Number: RC0402FR-0743KL; RoHS: Yes; Category: Chip SMD Resistors; Stock 1: 923044; Pricing 1: 1=0.10000, 10=0.01400, 100=0.00580, 1000=0.00262, 2500=0.00228, 5000=0.00188 (USD); Case/Package: 0402; Case Code (Metric): 1005; Case Code (Imperial): 0402; Weight: 2.3E-05oz; Size Code: 0402; Min Operating Temperature: -55°C; Max Operating Temperature: 155°C; Resistor Type: Thick Film; Package Quantity: 1; Tolerance: 1%; Packaging: Tape and Reel; Number of Terminations: 2; Termination: SMD/SMT; Max Power Dissipation: 63mW; Voltage Rating (DC): 50V; Features: Moisture Resistant; Series: RC; Construction: Rectangular; Resistance Tolerance: 1%; Technology: THICK FILM; Length: 1mm; Width: 0.02inch; Height: 0.016inch; Depth: 0.5mm; RoHS Compliant: Yes; Military Standard: Not; Lead Free: Lead Free; ComponentLink1URL: https://datasheet.ciiva.com/11819/0900766b80c66297-11819515.pdf?src-supplier=RSComponents; ComponentLink1Description: https://datasheet.ciiva.com/11819/0900766b80c66297-11819515.pdf?src-supplier=RSComponents; ComponentLink2URL: https://datasheet.ciiva.com/7850/1018594-7850009.pdf?src-supplier=Element14; ComponentLink2Description: https://datasheet.ciiva.com/7850/1018594-7850009.pdf?src-supplier=Element14; ComponentLink3URL: https://datasheet.ciiva.com/7850/1018594-7850008.pdf?src-supplier=Element14; ComponentLink3Description: https://datasheet.ciiva.com/7850/1018594-7850008.pdf?src-supplier=Element14; ComponentLink4URL: https://datasheet.ciiva.com/2453/pyu-r-int-thick-7-2453665.pdf?src-supplier=Digi-Key; ComponentLink4Description: https://datasheet.ciiva.com/2453/pyu-r-int-thick-7-2453665.pdf?src-supplier=Digi-Key; ComponentLink5URL: https://datasheet.ciiva.com/2453/pyu-r-int-thick-7-2453666.pdf?src-supplier=Digi-Key; ComponentLink5Description: https://datasheet.ciiva.com/2453/pyu-r-int-thick-7-2453666.pdf?src-supplier=Digi-Key; ComponentLink6URL: https://datasheet.ciiva.com/2453/pyu-r-int-thick-7-2453664.pdf?src-supplier=Digi-Key; ComponentLink6Description: https://datasheet.ciiva.com/2453/pyu-r-int-thick-7-2453664.pdf?src-supplier=Digi-Key; Supplier Part Number 1: 311-43.0KLRCT-ND; LCSC Part Number: C185415
R12 = RC0402FR-0749K9L: RES 49.9K OHM 1% 1/16W 0402; Manufacturer: Yageo; Power Rating: 62.5mW; Value: 49.9kR; Voltage Rating: 50V; Temperature Coefficient: 100ppm/°C; Max Power Dissipation: 63mW; Item Type: Resistor; Supplier: Digikey; Supplier Part Number: 311-49.9KLRCT-ND; Manufacturer Part Number: RC0402FR-0749K9L; RoHS: Yes; Category: Chip SMD Resistors; Stock: 5084418; Pricing: 1=0.1, 10=0.015, 50=0.0088, 100=0.0073, 500=0.00488, 1000=0.00417, 5000=0.00297 (USD); Case/Package: 0402; Case Code (Imperial): 0402; Case Code (Metric): 1005; Min Operating Temperature: -55°C; Max Operating Temperature: 155°C; Tolerance: 1%; Packaging: Tape and Reel; Termination: SMD/SMT; Voltage Rating (DC): 50V; Features: Moisture Resistant; Series: RC; Number of Terminations: 2; Construction: Rectangular; Length: 1mm; Depth: 0.5mm; RoHS Compliant: Yes; Military Standard: Not; Lead Free: Lead Free; ComponentLink1URL: https://datasheet.ciiva.com/17071/pyu-rc0402-51-rohs-l-6-r-17071066.pdf?src-supplier=Future+Electronics; ComponentLink1Description: https://datasheet.ciiva.com/17071/pyu-rc0402-51-rohs-l-6-r-17071066.pdf?src-supplier=Future+Electronics; LCSC Part Number: C137969
R17 R24 R28 = CRCW0402330RFKEDC: SMD Chip Resistor, 330 Ohm, ± 1%, 63 mW, 0402 [1005 Metric], Thick Film, General Purpose; Manufacturer: Vishay Semiconductors; Temperature Coefficient: 100ppm/°C; Max Power Dissipation: 63mW; Supplier: Digikey; Supplier Part Number: 541-3996-1-ND; Manufacturer Part Number: CRCW0402330RFKEDC; RoHS: Yes; Category: Chip SMD Resistors; Stock: 59136; Pricing: 1=0.1, 10=0.024, 50=0.0152, 100=0.0127, 500=0.00866, 1000=0.00746, 5000=0.00542 (USD); Case/Package: 0402; Case Code (Imperial): 0402; Case Code (Metric): 1005; Min Operating Temperature: -55°C; Max Operating Temperature: 155°C; Tolerance: 1%; Value: 330R; Series: CRCW-C; Packaging: Tape and Reel; Number of Terminations: 2; Lead Free: Lead Free; RoHS Compliant: Yes; ComponentLink1URL: http://www.vishay.com/docs/28773/crcwce3.pdf?src-supplier=Digikey; ComponentLink1Description: http://www.vishay.com/docs/28773/crcwce3.pdf?src-supplier=Digikey
R27 = RTT021004BTH: 62.5mW Thick Film Resistors ±100ppm/℃ ±0.1% 1MΩ 0402 Chip Resistor - Surface Mount ROHS; Manufacturer: RALEC; ComponentLink1Description: LCSC; ComponentLink1URL: https://www.lcsc.com/product-detail/Chip-Resistor-Surface-Mount_RALEC-RTT021004BTH_C525710.html; Manufacturer Part Number: RTT021004BTH; Package: 0402; LCSC Part Number: C525710; Item Type: Resistor
R32 = RMCF0402FT11K0: Res Thick Film 0402 11K Ohm 1% 0.063W(1/16W) ±100ppm/C Pad SMD Automotive T/R; Manufacturer: Stackpole Electronics; Value: 11kR; Max Power Dissipation: 63mW; Temperature Coefficient: 100ppm/°C; Supplier: Digikey; Supplier Part Number: RMCF0402FT11K0DKR-ND; Manufacturer Part Number: RMCF0402FT11K0; RoHS: Yes; Category: Chip SMD Resistors; Stock: 3070; Pricing: 1=0.1, 10=0.021, 50=0.0116, 100=0.0093, 500=0.00594, 1000=0.005, 5000=0.00345 (USD); Mounting Technology: Surface Mount; Case/Package: 0402; Case Code (Metric): 1005; Case Code (Imperial): 0402; Contact Plating: Tin,Matte; Min Operating Temperature: -55°C; Max Operating Temperature: 155°C; Packaging: Tape and Reel; Tolerance: 1%; Number of Terminations: 2; Features: Automotive AEC-Q200; Series: RMCF; Length: 0.039inch; Width: 0.02inch; Height: 0.016inch; Ratings: AEC-Q200; Radiation Hardening: No; Lead Free: Lead Free; RoHS Compliant: Yes; ComponentLink1URL: http://components.arrow.com/part/dataview/50581462S9720773N1174?src-supplier=Arrow+Electronics; ComponentLink1Description: http://components.arrow.com/part/dataview/50581462S9720773N1174?src-supplier=Arrow+Electronics; ComponentLink2URL: https://www.seielect.com/catalog/SEI-RMCF_RMCP.pdf?src-supplier=Avnet; ComponentLink2Description: https://www.seielect.com/catalog/SEI-RMCF_RMCP.pdf?src-supplier=Avnet; ComponentLink3URL: https://www.seielect.com/catalog/SEI-Packaging.pdf?src-supplier=Digikey; ComponentLink3Description: https://www.seielect.com/catalog/SEI-Packaging.pdf?src-supplier=Digikey
R37 R38 R40 R41 = CRGCQ0402F27R: SMD Chip Resistor, 27 Ohm, ± 1%, 63 mW, 0402 [1005 Metric], Thick Film, General Purpose; Manufacturer: TE Connectivity; Operating Supply Voltage: 50V; Power Rating: 62.5mW; Supplier: Digikey; Supplier Part Number: A129608CT-ND; Manufacturer Part Number: CRGCQ0402F27R; RoHS: Yes; Category: Chip SMD Resistors; Stock: 81404; Pricing: 1=0.1, 10=0.02, 50=0.0126, 100=0.0105, 500=0.00708, 1000=0.00609, 5000=0.00442 (USD); Voltage Rating: 50V; Voltage Rating (DC): 50V; Height: 400um; ComponentLink1URL: http://datasheet.octopart.com/CRGCQ0402F27R-TE-Connectivity-datasheet-114679081.pdf?src-supplier=Farnell; ComponentLink1Description: http://datasheet.octopart.com/CRGCQ0402F27R-TE-Connectivity-datasheet-114679081.pdf?src-supplier=Farnell; ComponentLink2URL: http://datasheet.octopart.com/CRGCQ0402F27R-TE-Connectivity-datasheet-114679081.pdf?src-supplier=Mouser; ComponentLink2Description: http://datasheet.octopart.com/CRGCQ0402F27R-TE-Connectivity-datasheet-114679081.pdf?src-supplier=Mouser; ComponentLink3URL: http://datasheet.octopart.com/CRGCQ0402F27R-TE-Connectivity-datasheet-114679081.pdf?src-supplier=Avnet; ComponentLink3Description: http://datasheet.octopart.com/CRGCQ0402F27R-TE-Connectivity-datasheet-114679081.pdf?src-supplier=Avnet; ComponentLink4URL: https://www.te.com/commerce/DocumentDelivery/DDEController?Action=srchrtrv&amp;DocNm=1773204-3&amp;DocType=DS&amp;DocLang=English&src-supplier=Digikey; ComponentLink4Description: https://www.te.com/commerce/DocumentDelivery/DDEController?Action=srchrtrv&amp;DocNm=1773204-3&amp;DocType=DS&amp;DocLang=English&src-supplier=Digikey; ComponentLink5URL: http://datasheet.octopart.com/CRGCQ0402F27R-TE-Connectivity-datasheet-114679081.pdf?src-supplier=Digikey; ComponentLink5Description: http://datasheet.octopart.com/CRGCQ0402F27R-TE-Connectivity-datasheet-114679081.pdf?src-supplier=Digikey; ComponentLink6URL: http://datasheet.octopart.com/CRGCQ0402F27R-TE-Connectivity-datasheet-114679081.pdf?src-supplier=Newark; ComponentLink6Description: http://datasheet.octopart.com/CRGCQ0402F27R-TE-Connectivity-datasheet-114679081.pdf?src-supplier=Newark; ComponentLink7URL: http://datasheet.octopart.com/CRGCQ0402F27R-TE-Connectivity-datasheet-114679081.pdf?src-supplier=Verical; ComponentLink7Description: http://datasheet.octopart.com/CRGCQ0402F27R-TE-Connectivity-datasheet-114679081.pdf?src-supplier=Verical; ComponentLink8URL: http://datasheet.octopart.com/CRGCQ0402F27R-TE-Connectivity-datasheet-114679081.pdf?src-supplier=Arrow+Electronics; ComponentLink8Description: http://datasheet.octopart.com/CRGCQ0402F27R-TE-Connectivity-datasheet-114679081.pdf?src-supplier=Arrow+Electronics; ComponentLink9URL: http://datasheet.octopart.com/CRGCQ0402F27R-TE-Connectivity-datasheet-114679081.pdf?src-supplier=Onlinecomponents.com; ComponentLink9Description: http://datasheet.octopart.com/CRGCQ0402F27R-TE-Connectivity-datasheet-114679081.pdf?src-supplier=Onlinecomponents.com; ComponentLink10URL: http://datasheet.octopart.com/CRGCQ0402F27R-TE-Connectivity-datasheet-114679081.pdf?src-supplier=Sager+Electronics; ComponentLink10Description: http://datasheet.octopart.com/CRGCQ0402F27R-TE-Connectivity-datasheet-114679081.pdf?src-supplier=Sager+Electronics; ComponentLink11URL: http://datasheet.octopart.com/CRGCQ0402F27R-TE-Connectivity-datasheet-114679081.pdf?src-supplier=Electro+Sonic; ComponentLink11Description: http://datasheet.octopart.com/CRGCQ0402F27R-TE-Connectivity-datasheet-114679081.pdf?src-supplier=Electro+Sonic; ComponentLink12URL: http://datasheet.octopart.com/CRGCQ0402F27R-TE-Connectivity-datasheet-114679081.pdf?src-supplier=Heilind+Electronics; ComponentLink12Description: http://datasheet.octopart.com/CRGCQ0402F27R-TE-Connectivity-datasheet-114679081.pdf?src-supplier=Heilind+Electronics; ComponentLink13URL: http://datasheet.octopart.com/CRGCQ0402F27R-TE-Connectivity-datasheet-114679081.pdf?src-supplier=Interstate+Connecting+Components; ComponentLink13Description: http://datasheet.octopart.com/CRGCQ0402F27R-TE-Connectivity-datasheet-114679081.pdf?src-supplier=Interstate+Connecting+Components; ComponentLink14URL: https://datasheet.octopart.com/CRGCQ0402F27R-TE-Connectivity-datasheet-114679081.pdf?src-supplier=Master+Electronics; ComponentLink14Description: https://datasheet.octopart.com/CRGCQ0402F27R-TE-Connectivity-datasheet-114679081.pdf?src-supplier=Master+Electronics; ComponentLink15URL: http://datasheet.octopart.com/CRGCQ0402F27R-TE-Connectivity-datasheet-114679081.pdf?src-supplier=TME; ComponentLink15Description: http://datasheet.octopart.com/CRGCQ0402F27R-TE-Connectivity-datasheet-114679081.pdf?src-supplier=TME
R39 = RC0402FR-07100RL: RES 100 OHM 1% 1/16W 0402; Manufacturer: Yageo; Power Rating: 62.5mW; Voltage Rating: 50V; Temperature Coefficient: 100ppm/°C; Max Power Dissipation: 63mW; Item Type: Resistor; Supplier 1: Mouser; Manufacturer Part Number: RC0402FR-07100RL; RoHS: Yes; Category: Chip SMD Resistors; Stock 1: 699545; Pricing 1: 1=0.10000, 10=0.01200, 50=0.01200, 100=0.00500, 1000=0.00300, 2500=0.00200, 10000=0.00100 (USD); Case/Package: 0402; Number of Pins: 2; Case Code (Imperial): 0402; Case Code (Metric): 1005; Size Code: 0402; Min Operating Temperature: -55°C; Max Operating Temperature: 155°C; Tolerance: 1%; Voltage Rating (DC): 50V; Resistance: 100R; Packaging: Tape and Reel; Termination: SMD/SMT; Resistor Type: Thick Film; Features: Moisture Resistant; Series: RC; Number of Terminations: 2; Resistance Tolerance: 1%; Construction: Rectangular; Technology: THICK FILM; Length: 1mm; Width: 0.5mm; Height: 0.32mm; Depth: 0.5mm; RoHS Compliant: Yes; REACH SVHC: No SVHC; Military Standard: Not; Lead Free: Lead Free; ComponentLink1URL: https://datasheet.ciiva.com/11808/0900766b80c66297-11808765.pdf?src-supplier=RSComponents; ComponentLink1Description: https://datasheet.ciiva.com/11808/0900766b80c66297-11808765.pdf?src-supplier=RSComponents; ComponentLink2URL: https://datasheet.ciiva.com/7849/1784430-7849810.pdf?src-supplier=Element14; ComponentLink2Description: https://datasheet.ciiva.com/7849/1784430-7849810.pdf?src-supplier=Element14; ComponentLink3URL: https://datasheet.ciiva.com/28367/1018594-28367226.pdf?src-supplier=Element14; ComponentLink3Description: https://datasheet.ciiva.com/28367/1018594-28367226.pdf?src-supplier=Element14; ComponentLink4URL: https://datasheet.ciiva.com/22747/1018594-22747511.pdf?src-supplier=Element14; ComponentLink4Description: https://datasheet.ciiva.com/22747/1018594-22747511.pdf?src-supplier=Element14; ComponentLink5URL: https://datasheet.ciiva.com/12667/pyu-rc0402-51-rohs-l-6-r-12667957.pdf?src-supplier=Mouser; ComponentLink5Description: https://datasheet.ciiva.com/12667/pyu-rc0402-51-rohs-l-6-r-12667957.pdf?src-supplier=Mouser; ComponentLink6URL: https://datasheet.ciiva.com/15189/getdatasheetpartid-329466-15189335.pdf?src-supplier=Verical; ComponentLink6Description: https://datasheet.ciiva.com/15189/getdatasheetpartid-329466-15189335.pdf?src-supplier=Verical; ComponentLink7URL: https://datasheet.ciiva.com/16740/pyu-rc0402-51-rohs-l-6-r-16740566.pdf?src-supplier=Future+Electronics; ComponentLink7Description: https://datasheet.ciiva.com/16740/pyu-rc0402-51-rohs-l-6-r-16740566.pdf?src-supplier=Future+Electronics; Supplier Part Number 1: 603-RC0402FR-07100RL; LCSC Part Number: C106232
R42 = CRCW040210R0FKEDHP: RES SMD 10 OHM 1% 1/5W 0402; Manufacturer: Vishay Dale; Power Rating: 125mW; Voltage Rating: 50V; Temperature Coefficient: 100ppm/°C; Max Power Dissipation: 200mW; Supplier 1: Digi-Key; Manufacturer Part Number: CRCW040210R0FKEDHP; Stock 1: 28500; Pricing 1: 1=0.15, 10=0.132, 100=0.0506, 1000=0.02226, 2500=0.01923, 5000=0.0172 (USD); Mount: Surface Mount; Case/Package: 0402; Weight: 2.3E-05oz; Case Code (Imperial): 0402; Case Code (Metric): 1005; Contact Plating: Tin; Min Operating Temperature: -55°C; Max Operating Temperature: 155°C; Resistance: 10R; Tolerance: 1%; Packaging: Tape and Reel; Package Quantity: 10000; Termination: SMD/SMT; Resistor Type: Thick Film; Voltage Rating (DC): 50V; Features: Automotive AEC-Q200; Series: CRCW-HP; Number of Terminations: 2; Resistance Tolerance: 1%; Technology: THICK FILM; Construction: Rectangular; Length: 1mm; Width: 0.5mm; Height: 0.3mm; Depth: 0.5mm; Radiation Hardening: No; REACH SVHC: Unknown; Military Standard: Not; Lead Free: Lead Free; RoHS Compliant: Yes; ComponentLink1URL: http://www.mouser.com/ds/2/427/crcwhpe3-46056.pdf?src-supplier=Mouser; ComponentLink1Description: http://www.mouser.com/ds/2/427/crcwhpe3-46056.pdf?src-supplier=Mouser; Supplier Part Number 1: 541-10.0YCT-ND; LCSC Part Number: C4013850
R58-R61 = RC0805FR-070RL: RES 0 OHM JUMPER 1/8W 0805; Manufacturer: Yageo; Resistance: 0mR; Tolerance: 1%; Power Rating: 125mW; Item Type: Resistor; Supplier 1: Avnet; Manufacturer Part Number: RC0805FR-070RL; RoHS: Yes; Category: Chip SMD Resistors; Stock 1: 85000; Pricing 1: 5000=0.00281, 10000=0.00277, 20000=0.00269 (USD); Case/Package: 0805; Contact Plating: Tin,Matte; Case Code (Imperial): 0805; Case Code (Metric): 2012; Size Code: 0805; Min Operating Temperature: -55°C; Max Operating Temperature: 155°C; Resistor Type: Thick Film; Packaging: Tape and Reel; Features: Moisture Resistant; Series: RC; Max Power Dissipation: 125mW; Number of Terminations: 2; Construction: Rectangular; Length: 2mm; Depth: 1.25mm; Radiation Hardening: No; Military Standard: Not; Lead Free: Lead Free; RoHS Compliant: Yes; ComponentLink1URL: https://datasheet.ciiva.com/15189/getdatasheetpartid-348154-15189885.pdf?src-supplier=Verical; ComponentLink1Description: https://datasheet.ciiva.com/15189/getdatasheetpartid-348154-15189885.pdf?src-supplier=Verical; ComponentLink2URL: https://datasheet.ciiva.com/17042/rc0805-17042698.pdf?src-supplier=Future+Electronics; ComponentLink2Description: https://datasheet.ciiva.com/17042/rc0805-17042698.pdf?src-supplier=Future+Electronics; Supplier Part Number 1: RC0805FR-070RL; LCSC Part Number: C100045
U1 U7 U8 = LP5907MFX-3.3/NOPB: LDO Regulator Pos 3.3V 0.25A 5-Pin SOT-23 T/R; Manufacturer: Texas Instruments; Number of Outputs: 1; Min Input Voltage: 2.2V; Max Supply Voltage: 5.5V; Max Output current: 250mA; Dropout Voltage: 250mV; Polarity: Positive; Quiescent Current: 25uA; Accuracy: 2%; Power Supply Rejection Ratio (PSRR): 60dB; Output Type: Fixed; Max Supply Current: 425uA; Nominal Supply Current: 12uA; Number of Channels: 1NUMBER; Item Type: IC; Supplier: Digikey; Supplier Part Number: 296-38557-1-ND; Manufacturer Part Number: LP5907MFX-3.3/NOPB; RoHS: Yes; Category: Voltage Regulators - Linear; Stock: 22318; Pricing: 1=0.6, 10=0.512, 25=0.478, 100=0.3823, 250=0.35496, 500=0.30034, 1000=0.23209 (USD); Mounting Technology: Surface Mount; Case/Package: SOT-23-5; Pins: 5; Min Operating Temperature: -40°C; Max Operating Temperature: 125°C; Output Voltage: 3.3V; Packaging: Tape and Reel; Output Current: 250mA; Package Quantity: 3000; Number of Regulators: 1; Nominal Output Voltage: 3.3V; Series: -; Output Configuration: Positive; Min Supply Voltage: 2.2V; Length: 2.9mm; Width: 1.6mm; Height: 1.45mm; Thickness: 1.2mm; Radiation Hardening: No; Reach SVHC Compliant: No; Lead Free: Lead Free; RoHS Compliant: Yes; ComponentLink1URL: https://datasheet.ciiva.com/48475/lp5907-48475084.pdf?src-supplier=Avnet; ComponentLink1Description: https://datasheet.ciiva.com/48475/lp5907-48475084.pdf?src-supplier=Avnet; Package: SOT-23-5; JLCPCB Part Number: C80670; ComponentLink2Description: JLCPCB; ComponentLink2URL: https://jlcpcb.com/partdetail/TexasInstruments-LP5907MFX_3_3NOPB/C80670
U2 = MAX889RESA+: IC REG CHRG PUMP ADJ 200MA 8SOIC; Manufacturer: Maxim; Supplier: Mouser; Supplier Part Number: 700-MAX889RESA; Manufacturer Part Number: MAX889RESA+; RoHS: Yes; Item Type: IC; Stock: 621; Pricing: 1=6.21, 10=5.28, 50=5.28, 100=4.56, 1000=3.28, 10000=3.11 (USD); ComponentLink1URL: https://datasheet.ciiva.com/30477/0900766b81253d0c-30477617.pdf?src-supplier=Rs; ComponentLink1Description: https://datasheet.ciiva.com/30477/0900766b81253d0c-30477617.pdf?src-supplier=Rs; ComponentLink2URL: https://datasheet.ciiva.com/3215/max889-3215733.pdf?src-supplier=Avnet; ComponentLink2Description: https://datasheet.ciiva.com/3215/max889-3215733.pdf?src-supplier=Avnet; ComponentLink3URL: https://datasheet.ciiva.com/4874/max889-4874923.pdf?src-supplier=Mouser; ComponentLink3Description: https://datasheet.ciiva.com/4874/max889-4874923.pdf?src-supplier=Mouser; ComponentLink4URL: https://datasheet.ciiva.com/2028/max889-2028980.pdf?src-supplier=Digikey; ComponentLink4Description: https://datasheet.ciiva.com/2028/max889-2028980.pdf?src-supplier=Digikey
U3 = MAX3080EESD+T: MAX3080 Series 115 kbps 5.25 V Full Duplex RS-485/RS-422 Transceiver - SOIC-14; Manufacturer: Maxim; Number of Receivers: 1; Operating Supply Voltage: 5V; Max Power Dissipation: 800mW; Output Current: 1uA; Output Voltage: 13V; Supply Current: 375uA; Item Type: IC; Supplier: Digikey; Supplier Part Number: MAX3080EESD+TCT-ND; Manufacturer Part Number: MAX3080EESD+T; RoHS: Yes; Category: RS-232 / RS-422 / RS-485 Interface ICs; Stock: 1816; Pricing: 1=6.26, 10=5.625, 25=5.3176, 100=4.6086, 250=4.37228, 500=3.92324, 1000=3.30876 (USD); Mounting Technology: Surface Mount; Case/Package: SOIC; Min Operating Temperature: -40°C; Max Operating Temperature: 85°C; Packaging: Tape and Reel; Number of Transmitters: 1; Logic Function: Transceiver; Package Quantity: 2500; Number of Drivers: 1; Data Rate: 115Kbps; Series: MAX3080E; RoHS Compliant: Yes; Lead Free: Lead Free; ComponentLink1URL: https://datasheet.ciiva.com/12260/max3080e-max3089e-99170-12260438.pdf?src-supplier=Mouser; ComponentLink1Description: https://datasheet.ciiva.com/12260/max3080e-max3089e-99170-12260438.pdf?src-supplier=Mouser; ComponentLink2URL: https://datasheet.ciiva.com/14430/max3080e-max3089e-14430038.pdf?src-supplier=Avnet; ComponentLink2Description: https://datasheet.ciiva.com/14430/max3080e-max3089e-14430038.pdf?src-supplier=Avnet; ComponentLink3URL: https://datasheet.ciiva.com/1774/max3080e-max3089e-1774749.pdf?src-supplier=Digikey; ComponentLink3Description: https://datasheet.ciiva.com/1774/max3080e-max3089e-1774749.pdf?src-supplier=Digikey; Package: 14-SOIC